# Altium schematic sheet HDMI.SchDoc
size A; SheetNumber: 2; SheetTotal: 2
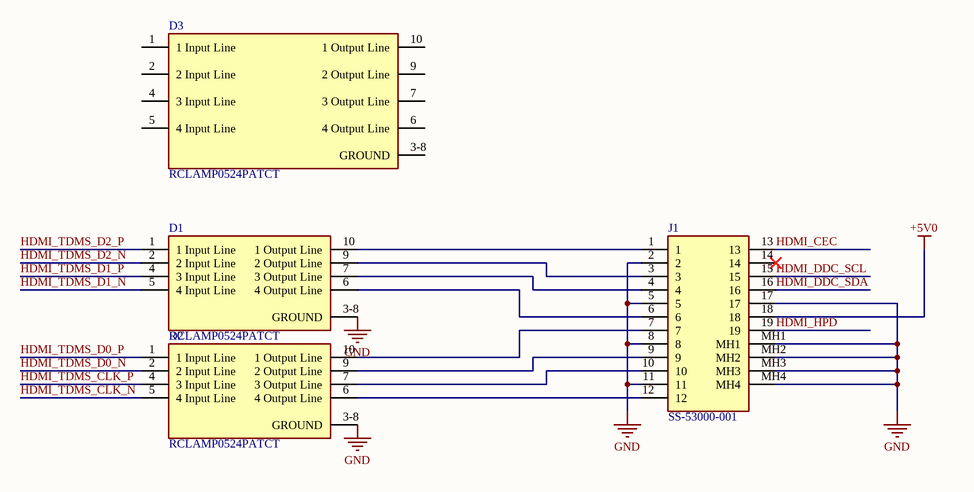
[diagram p0: HDMI.SchDoc]

## Parts
D1  RCLAMP0524PATCT  [FP-SLP2510P8-MFG]
D2  RCLAMP0524PATCT  [FP-SLP2510P8-MFG]
D3  RCLAMP0524PATCT  [FP-SLP2510P8-MFG]
J1  SS-53000-001  [SS53000001]

## Nets
+5V0: J1.18
GND: D1.3-8(GROUND) D2.3-8(GROUND) J1.2 J1.5 J1.8 J1.11 J1.17 J1.MH1 J1.MH2 J1.MH3 J1.MH4
HDMI_CEC: J1.13
HDMI_DDC_SCL: J1.15
HDMI_DDC_SDA: J1.16
HDMI_HPD: J1.19
HDMI_TDMS_CLK_N: D2.5(4_Input_Line)
HDMI_TDMS_CLK_P: D2.4(3_Input_Line)
HDMI_TDMS_D0_N: D2.2(2_Input_Line)
HDMI_TDMS_D0_P: D2.1(1_Input_Line)
HDMI_TDMS_D1_N: D1.5(4_Input_Line)
HDMI_TDMS_D1_P: D1.4(3_Input_Line)
HDMI_TDMS_D2_N: D1.2(2_Input_Line)
HDMI_TDMS_D2_P: D1.1(1_Input_Line)
NetD1_6: D1.6(4_Output_Line) J1.6
NetD1_7: D1.7(3_Output_Line) J1.4
NetD1_9: D1.9(2_Output_Line) J1.3
NetD1_10: D1.10(1_Output_Line) J1.1
NetD2_6: D2.6(4_Output_Line) J1.12
NetD2_7: D2.7(3_Output_Line) J1.10
NetD2_9: D2.9(2_Output_Line) J1.9
NetD2_10: D2.10(1_Output_Line) J1.7

Not connected (* = marked no-connect by the designer): D3 1(1_Input_Line) 2(2_Input_Line) 3-8(GROUND) 4(3_Input_Line) 5(4_Input_Line) 6(4_Output_Line) 7(3_Output_Line) 9(2_Output_Line) 10(1_Output_Line); J1 14*

## Library data of the parts
D1 D2 = RCLAMP0524PATCT: TVS DIODE 5V 15V SLP2510P8; Number of Unidirectional Channels: 4; Min Breakdown Voltage: 6V; Direction: Unidirectional; Power Line Protection: Yes; Peak Pulse Power: 150W; Leakage Current: 1uA; Capacitance: 0.8pF; Peak Pulse Current: 1A; Series: RailClamp®; Min Operating Temperature: -55°C; Number of Bidirectional Channels: 4; Mount: Surface Mount; Clamping Voltage: 15V; Clamping Voltage-Max: 15V; Max Operating Temperature: 125°C; Working Voltage: 5V; Case/Package: SMD/SMT; Packaging: Tape and Reel; RoHS Compliant: Yes; Reverse Standoff Voltage: 5V; Radiation Hardening: No; Number of Pins: 10; Depth: 1mm; Length: 2.5mm
D3 = CMP-56445-000006-1: TVS DIODE 5V 15V SLP2510P8; Number of Unidirectional Channels: 4; Min Breakdown Voltage: 6V; Direction: Unidirectional; Power Line Protection: Yes; Peak Pulse Power: 150W; Leakage Current: 1uA; Capacitance: 0.8pF; Peak Pulse Current: 1A; Series: RailClamp®; Min Operating Temperature: -55°C; Number of Bidirectional Channels: 4; Mount: Surface Mount; Clamping Voltage: 15V; Clamping Voltage-Max: 15V; Max Operating Temperature: 125°C; Working Voltage: 5V; Case/Package: SMD/SMT; Packaging: Tape and Reel; RoHS Compliant: Yes; Reverse Standoff Voltage: 5V; Radiation Hardening: No; Number of Pins: 10; Depth: 1mm; Length: 2.5mm
J1 = SS-53000-001: Connector; Manufacturer_Name: BelFuse; Datasheet Link: https://componentsearchengine.com/Datasheets/1/SS-53000-001.pdf; Height: 6.18mm; Manufacturer_Part_Number: SS-53000-001; Mouser Part Number: 530-SS-53000-001; Mouser Price/Stock: https://www.mouser.co.uk/ProductDetail/Stewart-Connector-Bel/SS-53000-001?qs=BJlw7L4Cy79s8HuVQy18%252BQ%3D%3D; Arrow Part Number: SS-53000-001; Arrow Price/Stock: https://www.arrow.com/en/products/ss-53000-001/bel-group?utm_currency=USD&region=europe